# Altium schematic sheet S7_Ethernet.SchDoc
size A3; SheetNumber: 4; SheetTotal: 7
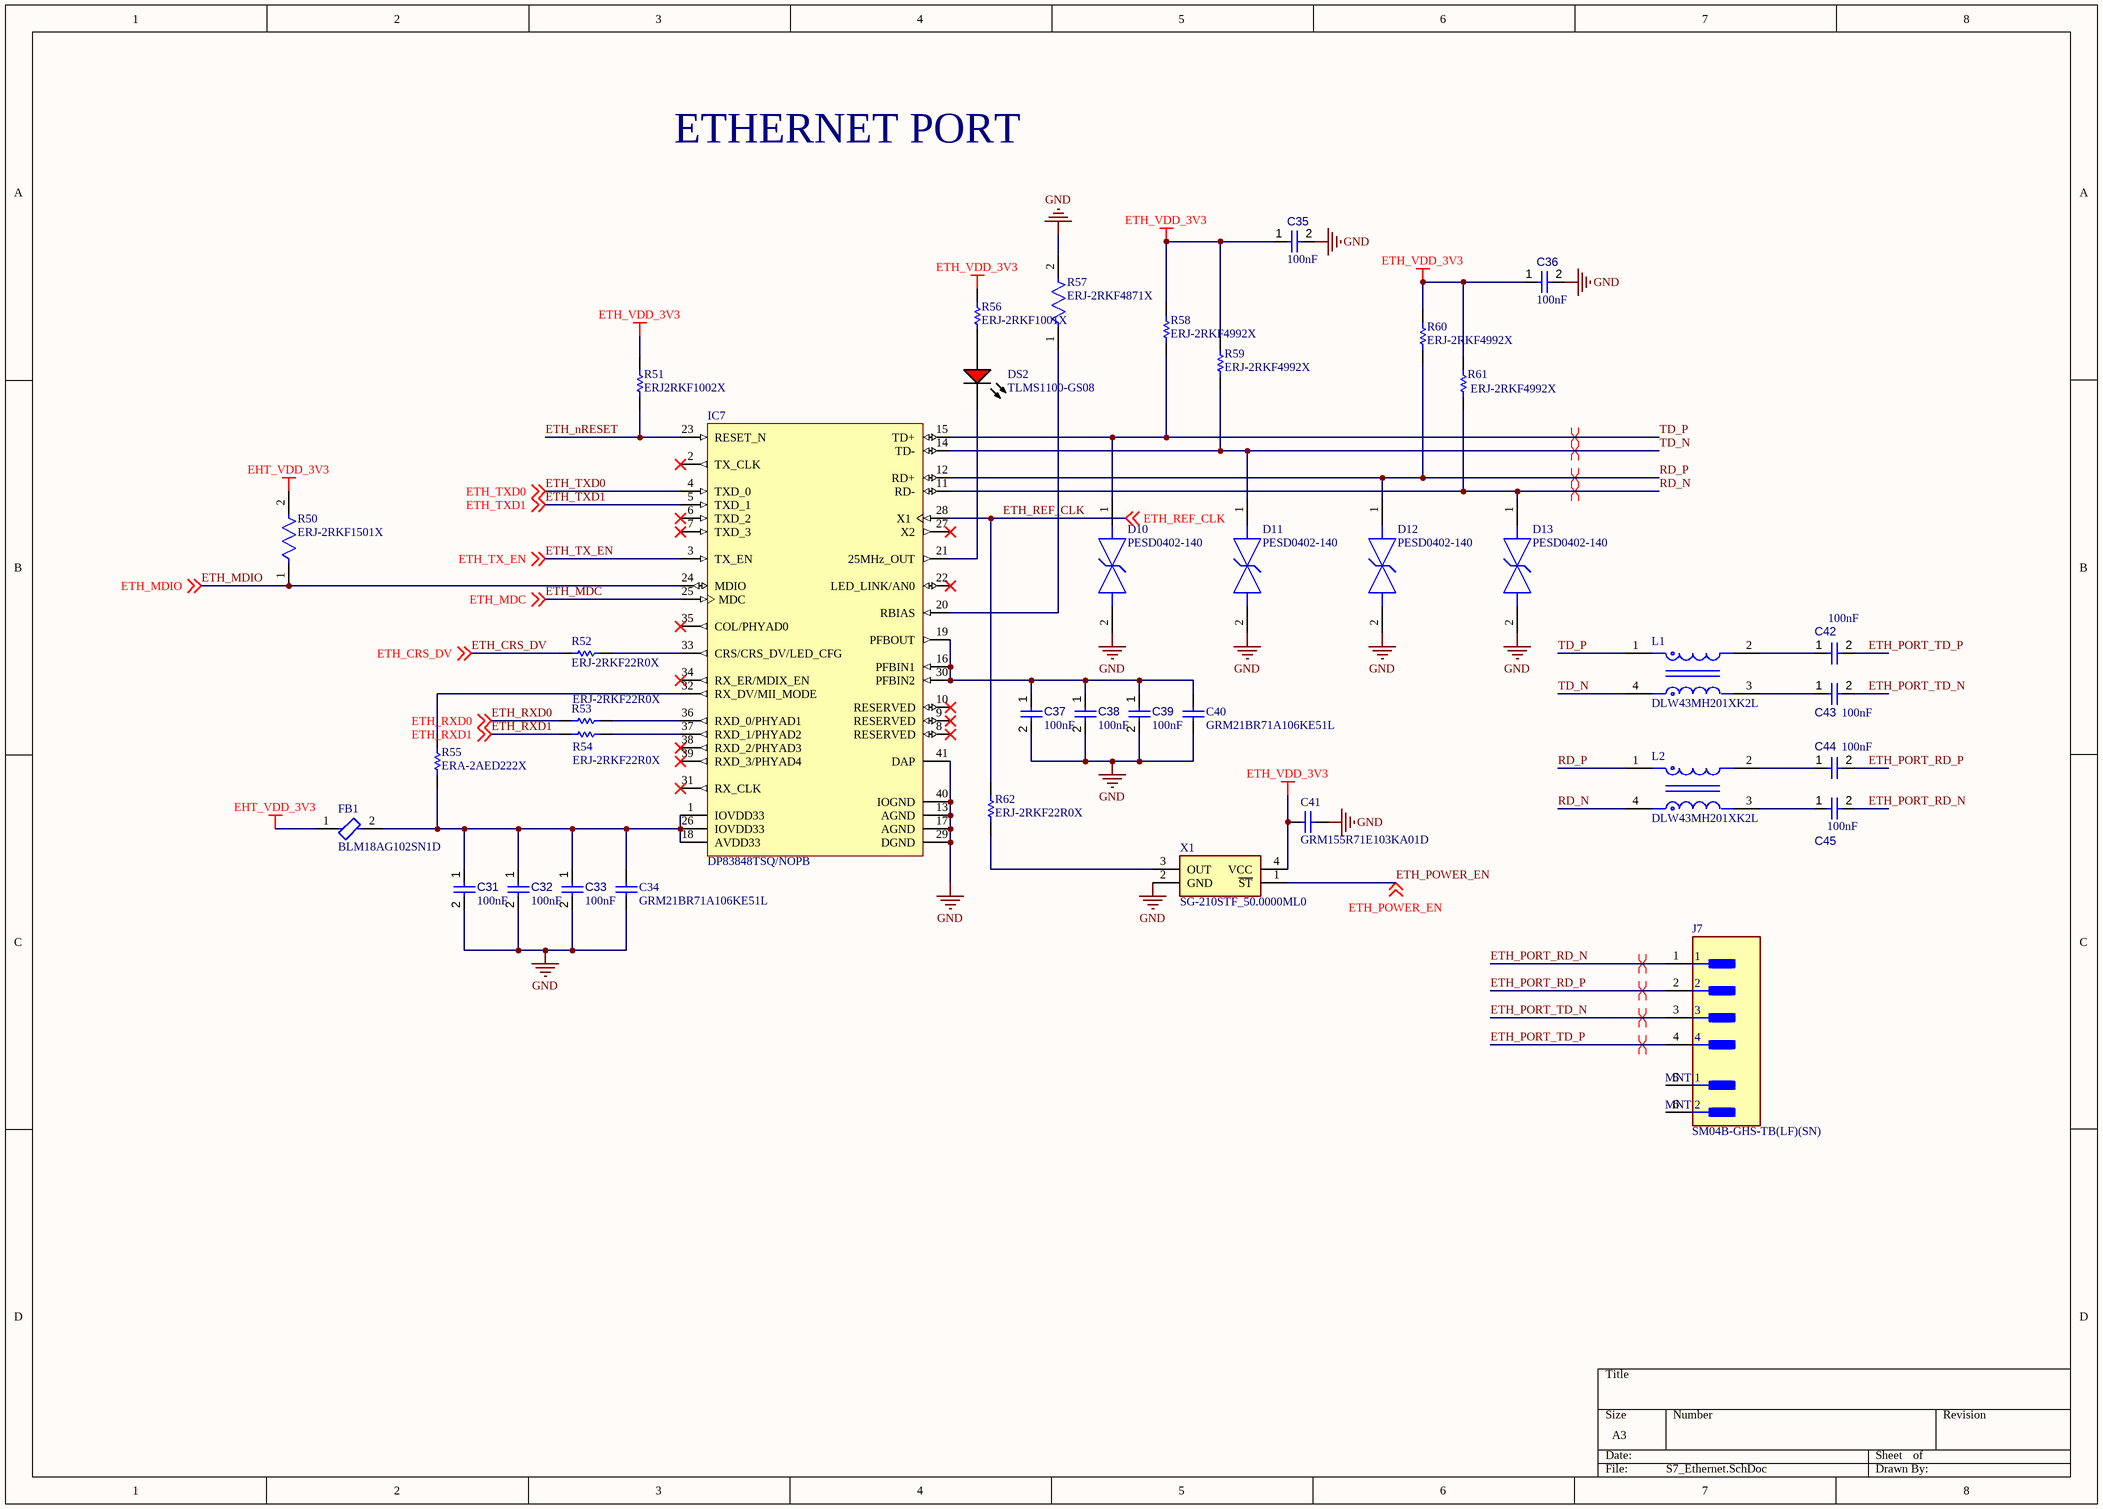
[diagram p0: S7_Ethernet.SchDoc]

## Parts
C31  value 100nF  [CAPC0402(1005)60_L]  (hidden comment: Capacitor 100nF +/-20% 25V 0402)
C32  value 100nF  [CAPC0402(1005)60_L]  (hidden comment: Capacitor 100nF +/-20% 25V 0402)
C33  value 100nF  [CAPC0402(1005)60_L]  (hidden comment: Capacitor 100nF +/-20% 25V 0402)
C34  GRM21BR71A106KE51L  [CAPC2013X140X45NL15T25]
C35  value 100nF  [CAPC0402(1005)60_L]  (hidden comment: Capacitor 100nF +/-20% 25V 0402)
C36  value 100nF  [CAPC0402(1005)60_L]  (hidden comment: Capacitor 100nF +/-20% 25V 0402)
C37  value 100nF  [CAPC0402(1005)60_L]  (hidden comment: Capacitor 100nF +/-20% 25V 0402)
C38  value 100nF  [CAPC0402(1005)60_L]  (hidden comment: Capacitor 100nF +/-20% 25V 0402)
C39  value 100nF  [CAPC0402(1005)60_L]  (hidden comment: Capacitor 100nF +/-20% 25V 0402)
C40  GRM21BR71A106KE51L  [CAPC2013X140X45NL15T25]
C41  GRM155R71E103KA01D  [CAPC1005X55X25LL05T10]
C42  value 100nF  [CAPC0402(1005)60_L]  (hidden comment: Capacitor 100nF +/-20% 25V 0402)
C43  value 100nF  [CAPC0402(1005)60_L]  (hidden comment: Capacitor 100nF +/-20% 25V 0402)
C44  value 100nF  [CAPC0402(1005)60_L]  (hidden comment: Capacitor 100nF +/-20% 25V 0402)
C45  value 100nF  [CAPC0402(1005)60_L]  (hidden comment: Capacitor 100nF +/-20% 25V 0402)
D10  PESD0402-140  [FP-PESD0402-MFG]
D11  PESD0402-140  [FP-PESD0402-MFG]
D12  PESD0402-140  [FP-PESD0402-MFG]
D13  PESD0402-140  [FP-PESD0402-MFG]
DS2  TLMS1100-GS08  [VISH-TLMX1100_V]
FB1  BLM18AG102SN1D  [FP-BLM18-0_15-t0_8-MFG]
IC7  DP83848TSQ/NOPB  [RTA0040A_V]
J7  SM04B-GHS-TB(LF)(SN)  [FP-SM04B-GHS-TB_LF_SN-MFG]
L1  DLW43MH201XK2L  [FP-DLW43-0_2-t2_7-MFG]
L2  DLW43MH201XK2L  [FP-DLW43-0_2-t2_7-MFG]
R50  ERJ-2RKF1501X  [FP-ERJ2RK-IPC_A]
R51  ERJ2RKF1002X  [RESC1005X40X25LL05T05]
R52  ERJ-2RKF22R0X  [RESC1005X40X25ML05T05]
R53  ERJ-2RKF22R0X  [RESC1005X40X25ML05T05]
R54  ERJ-2RKF22R0X  [RESC1005X40X25ML05T05]
R55  ERA-2AED222X  [RESC1005X40X25ML10T10]
R56  ERJ-2RKF1001X  [RESC1005X40X25NL05T05]
R57  ERJ-2RKF4871X  [FP-ERJ2RK-MFG]
R58  ERJ-2RKF4992X  [RESC1005X40X25LL05T05]
R59  ERJ-2RKF4992X  [RESC1005X40X25LL05T05]
R60  ERJ-2RKF4992X  [RESC1005X40X25LL05T05]
R61  ERJ-2RKF4992X  [RESC1005X40X25LL05T05]
R62  ERJ-2RKF22R0X  [RESC1005X40X25ML05T05]
X1  SG-210STF_50.0000ML0  [SG210STF500000ML0]

## Nets
EHT_VDD_3V3: FB1.1 R50.2
ETH_VDD_3V3: C35.1 C36.1 C41.1 R51.2 R56.2 R58.2 R59.2 R60.2 R61.2 X1.4(VCC)
GND: C31.2 C32.2 C33.2 C34.1 C35.2 C36.2 C37.2 C38.2 C39.2 C40.1 C41.2 D10.2 D11.2 D12.2 D13.2 IC7.13(AGND) IC7.17(AGND) IC7.29(DGND) IC7.40(IOGND) IC7.41(DAP) R57.2 X1.2(GND)
ETH_CRS_DV: R52.1 ; off-sheet ETH_CRS_DV
ETH_MDC: IC7.25(MDC) ; off-sheet ETH_MDC
ETH_MDIO: IC7.24(MDIO) R50.1 ; off-sheet ETH_MDIO
ETH_nRESET: IC7.23(RESET_N) R51.1
ETH_PORT_RD_N: C45.2 J7.1
ETH_PORT_RD_P: C44.2 J7.2
ETH_PORT_TD_N: C43.2 J7.3
ETH_PORT_TD_P: C42.2 J7.4
ETH_POWER_EN: X1.1(~{ST}) ; off-sheet ETH_POWER_EN
ETH_REF_CLK: IC7.28(X1) R62.2 ; off-sheet ETH_REF_CLK
ETH_RXD0: R53.1 ; off-sheet ETH_RXD0
ETH_RXD1: R54.1 ; off-sheet ETH_RXD1
ETH_TX_EN: IC7.3(TX_EN) ; off-sheet ETH_TX_EN
ETH_TXD0: IC7.4(TXD_0) ; off-sheet ETH_TXD0
ETH_TXD1: IC7.5(TXD_1) ; off-sheet ETH_TXD1
RD_N: D13.1 IC7.11(RD-) L2.4 R61.1
RD_P: D12.1 IC7.12(RD+) L2.1 R60.1
TD_N: D11.1 IC7.14(TD-) L1.4 R59.1
TD_P: D10.1 IC7.15(TD+) L1.1 R58.1
NetC31_1: C31.1 C32.1 C33.1 C34.2 FB1.2 IC7.1(IOVDD33) IC7.18(AVDD33) IC7.26(IOVDD33) R55.1
NetC37_1: C37.1 C38.1 C39.1 C40.2 IC7.16(PFBIN1) IC7.19(PFBOUT) IC7.30(PFBIN2)
NetC42_1: C42.1 L1.2
NetC43_1: C43.1 L1.3
NetC44_1: C44.1 L2.2
NetC45_1: C45.1 L2.3
NetDS2_1: DS2.1(A) R56.1
NetDS2_2: DS2.2(K) IC7.21(25MHz_OUT)
NetIC7_20: IC7.20(RBIAS) R57.1
NetIC7_32: IC7.32(RX_DV/MII_MODE) R55.2
NetIC7_33: IC7.33(CRS/CRS_DV/LED_CFG) R52.2
NetIC7_36: IC7.36(RXD_0/PHYAD1) R53.2
NetIC7_37: IC7.37(RXD_1/PHYAD2) R54.2
NetR62_1: R62.1 X1.3(OUT)

Not connected (* = marked no-connect by the designer): IC7 2(TX_CLK)* 6(TXD_2)* 7(TXD_3)* 8(RESERVED)* 9(RESERVED)* 10(RESERVED)* 22(LED_LINK/AN0)* 27(X2)* 31(RX_CLK)* 34(RX_ER/MDIX_EN)* 35(COL/PHYAD0)* 38(RXD_2/PHYAD3)* 39(RXD_3/PHYAD4)*; J7 5(MNT_1) 6(MNT_2)

## Layout directives
differential pair: ETH_PORT_RD_N, ETH_PORT_RD_P, ETH_PORT_TD_N, ETH_PORT_TD_P, RD_N, RD_P, TD_N, TD_P

## Notes on the sheet
- ETHERNET PORT

## Library data of the parts
C31-C33 C35-C39 C42-C45 = CMP-001-00065-4: Chip Capacitor, 100nF +/-20%, 25V, 0402, Thickness 0.6 mm; Tolerance: 10%; Max Operating Temperature: 85°C; Min Operating Temperature: -55°C; Pins: 2; Voltage Rating: 25V; Mounting Technology: SMT; Case/Package: 0402
C34 C40 = CMP-2007-03395-1: Manufacturer: Murata; Part Number: GRM21BR71A106KE51L
C41 = CMP-1034-01880-2: Manufacturer: Murata; Part Number: GRM155R71E103KA01D
D10-D13 = CMP-08607-000011-1: TVS DIODE 14V 40V 0402; Manufacturer: Littelfuse Inc.; Automotive Grade: Grade 1; Capacitance: 0.25pF; Value: 0.25pF; Direction: Bidirectional; Number Of Channels: 1; Temperature Range Low: -55°C; Lead Free: Yes; Temperature: -55°C to +125°C; Digikey Description: TVS DIODE 14V 40V 0402; Automotive: Yes; Device Class L2: TVS Diodes; Reverse Standoff Voltage: 14V; Device Class L1: Circuit Protection; Ipc Land Pattern Name: DIOC10050X33; Manufacturer Part Number: PESD0402-140; Breakdown Voltage: 14V; Height: 0.43mm; Clamping Voltage: 40V; RoHS: TRUE; Temperature Range High: +125°C; Device Class L3: unset; Octopart: https://octopart.com/pesd0402-140-littelfuse-74215061; Package: PESD0402; ComponentLink2URL: https://www.littelfuse.com/~/media/electronics/datasheets/polymer_esd_suppressors/littelfuse_polymer_esd_suppressor_pesd_catalog_datasheet.pdf.pdf; Category: Diode; ComponentLink2Description: Datasheet
DS2 = CMP-1666-00027-1: LED, RED, 2.1 V, -40 to 100 degC, 2-Pin SMD (0603), RoHS, Tape and Reel; Type (Capacitors): C0G; Resistance: 100000000000 Ohm; Capacitance: 12 pF; Voltage Rating: 50 V; Tolerance: 5%; Min Operating Temperature: -55degC; REACH SVHC: No SVHC; ComponentLink2Description: Datasheet; ComponentLink1URL: http://www.vishay.com/; Width: 0.8 mm; Package Quantity: 4000; PackageReference: TLMX1100; ComponentLink2URL: http://www.vishay.com/docs/83173/tlmb1100.pdf; Case/Package: 0603; Case Code (Metric): 1608; Packaging: Tape and Reel; Pins: 2; ComponentLink1Description: Manufacturer URL; Max Operating Temperature: 125degC; Height: 0.8 mm; Length: 1.6 mm; Mount: Surface Mount; PackageDescription: 2-Pin Surface Mount Device, Body 1.6 x 0.8 mm; DatasheetVersion: Rev. 2.7, 03/2016; Case Code (Imperial): 0603; Voltage Rating (DC): 50 V; RoHSCompliant: True; Radiation Hardening: No
FB1 = CMP-0686-00457-3: Chip Ferrite Bead, 0603, 1000Ω @ 100MHz, 0.5Ω, 25%, 450mA; Number of Circuits: 1; Max DC Current: 400mA; Shielding: Unshielded; DC Resistance (DCR): 500mR; Material: Steel; DC Resistance-Max: 700mR; Impedance: 1kR; Case Code (Imperial): 0603; Max Current Rating: 400mA; Frequency: 100MHz; Min Operating Temperature: -55°C; Case/Package: 0603; Depth: 0.8mm; Lead Free: Lead Free; Core Material: Ferrite; Current Rating: 400mA; Resistance: 500mR; Case Code (Metric): 1608; DC Current: 400mA; Package Quantity: 1; Packaging: Tape and Reel; Width: 0.8mm; Military Standard: Not; Height: 0.8mm; Series: BLM18A; Max Operating Temperature: 125°C; Tolerance: 25%; Termination: SMD/SMT; Test Frequency: 100MHz; Number of Lines: 1; Number of Pins: 2; REACH SVHC: No SVHC; Length: 1.6mm; Radiation Hardening: No
IC7 = CMP-0058-00190-4: PHYTER® Mini - Industrial Temperature Single 10/100 Ethernet Transceiver, 40-pin LLP, Pb-Free, 250 Reel; Manufacturer: Texas Instruments; PowerWise: N; PackageTopMarking: NS*UZXYTTE#*83848TSQ; CompType: Interface IC; High-Reliability: Y; PinCount: 40; RoHS: Y; PartNumber: DP83848TSQ/NOPB; ComponentLink1URL: http://www.ti.com/general/docs/lit/getliterature.tsp?genericPartNumber=DP83848T&fileType=pdf; PackageDescription: LLP, Quad, 6 x 6 x 0.8mm, 40 Lead, Small DAP, 0.5mm Pitch, No Pullback; ComponentLink1Description: Datasheet URL; PackageReference: RTA0040A
J7 = CMP-17439-000411-1: CONN HEADER SMD R/A 4POS 1.25MM; Voltage Rating: 50V; Number of Contacts: 4; Current Rating: 1A; Termination: Solder; Mount: Surface Mount; REACH SVHC: No SVHC; Packaging: Cut Tape; Contact Material: Bronze; Series: GH; Orientation: Right Angle; Lead Free: Lead Free; Housing Material: Nylon; Contact Plating: Tin; Housing Color: Natural; Number of Rows: 1; Pitch: 1.25mm; Number of Positions: 4
L1 L2 = CMP-06045-000406-1: CMC 200UH 110MA 2LN SMD AEC-Q200; Voltage Rating (DC): 20V; Number of Lines: 2; DC Resistance (DCR): 4.5R; Max Operating Temperature: 105°C; Packaging: Cut Tape; Mount: Surface Mount; Max Current Rating: 110mA; Ratings: AEC-Q200; Min Operating Temperature: -40°C
R50 = CMP-2002-00693-2: RES SMD 1.5K OHM 1% 1/10W 0402; Voltage Rating (DC): 50V; Temperature Coefficient: 100ppm/°C; Power Rating: 100mW; Resistance: 1.5kR; Features: Automotive AEC-Q200; Termination: SMD/SMT; Size Code: 0402; Mount: Surface Mount; Min Operating Temperature: -55°C; Construction: Rectangular; Case Code (Metric): 1005; Depth: 0.5mm; Max Operating Temperature: 155°C; RoHS Compliant: Yes; Packaging: Tape and Reel; Number of Pins: 2; Military Standard: Not; Package Quantity: 1; Height: 0.35mm; Resistor Type: Thick Film; Radiation Hardening: No; Length: 1mm; Case Code (Imperial): 0402; Tolerance: 1%; Voltage Rating: 50V; Resistance Tolerance: 1%; Contact Plating: Tin; Case/Package: 0402; REACH SVHC: No SVHC; Max Power Dissipation: 100mW; Series: ERJ; Technology: THICK FILM; Number of Terminations: 2; Width: 0.02inch; Lead Free: Lead Free
R51 = CMP-2000-07588-1: Chip Resistor, 10 KOhm, +/- 1%, 0.1 W, -55 to 155 degC, 0402 (1005 Metric), RoHS, Tape and Reel; Manufacturer: Panasonic; Power Rating: 100mW; Voltage Rating: 50V; Resistance: 10KOhm; Case\/Package: 0402; Temperature Coefficient: 100ppm\/degreesC; RoHSCompliant: True; Lead Free: LeadFree; Package Quantity: 1; Contact Plating: Tin; Length: 1mm; Radiation Hardening: No; REACH SVHC: NoSVHC; Max Operating Temperature: 155degC; Depth: 0.5mm; Case Code (Imperial): 0402; Military Standard: Not; Package Description: 2-Pin Surface Mount Device, Body 1 x 0.5 mm; Termination: SMD/SMT; Case Code (Metric): 1005; Height: 0.35mm; Packaging: TapeandReel; Voltage Rating (DC): 50V; Package Reference: 402; Number of Pins: 2; Tolerance: 1%; Mounting Technology: SurfaceMount; Width: 0.02inch; Mount: SurfaceMount; Datasheet URL: https://industrial.panasonic.com/cdbs/www-data/pdf/RDA0000/AOA0000C304.pdf; Composition: ThickFilm; Datasheet Version: 02/2017; Manufacturer URL: http://www.panasonic.com/; Max Power Dissipation: 100mW; Number of Terminations: 2; Min Operating Temperature: -55degC
R52-R54 R62 = CMP-2002-01135-4: Chip Resistor, 22 Ohm, +/- 1%, 0.1 W, -55 to 155 degC, 0402 (1005 Metric), RoHS, Tape and Reel; Case\/Package: 0402; Resistance: 22 Ohm; Power Rating: 100 mW; Voltage Rating: 50 V; ComponentLink2Description: Datasheet; PartNumber: ERJ-2RKF22R0X; Packaging: Tape and Reel; Weight: 2.8E-05oz; Pins: 2; Case Code (Imperial): 0402; Width: 0.5 mm; ComponentLink2URL: http://industrial.panasonic.com/cdbs/www-data/pdf/RDA0000/AOA0000C86.pdf; Height: 0.35 mm; PackageReference: 0402; REACH SVHC: Yes; Min Operating Temperature: -55 degC; Length: 1 mm; DatasheetVersion: 04/2015; RoHSCompliant: true; Package Quantity: 10000; Case Code (Metric): 1005; PackageDescription: 2-Pin Surface Mount Device, Body 1 x 0.5 mm; ComponentLink1URL: http://www.panasonic.com/; Mount: Surface Mount; Mounting Technology: Surface Mount; Tolerance: 1%; Max Operating Temperature: 155 degC; ComponentLink1Description: Manufacturer URL
R55 = CMP-2002-05848-1: Manufacturer: Panasonic; Part Number: ERA-2AED222X
R56 = CMP-1011-00510-4: Chip Resistor, 1 KOhm, +/- 1%, 100 mW, -55 to 155 degC, 0402 (1005 Metric), RoHS, Tape and Reel; Manufacturer: Basic Passives; Voltage Rating: 50 V; Case\/Package: 0402; Resistance: 1 KOhm; Power Rating: 100 mW; PartNumber: ERJ-2RKF1001X; DatasheetVersion: 04/2015; Radiation Hardening: No; Pins: 2; Height: 0.35 mm; RoHSCompliant: true; Case Code (Imperial): 0402; ComponentLink2Description: Datasheet; ComponentLink1Description: Manufacturer URL; PackageReference: 0402; Mount: Surface Mount; Package Quantity: 10000; Tolerance: 1%; ComponentLink1URL: http://www.panasonic.com/; PackageDescription: 2-Pin Surface Mount Device, Body 1 x 0.5 mm; Mounting Technology: Surface Mount; Case Code (Metric): 1005; ComponentLink2URL: http://industrial.panasonic.com/cdbs/www-data/pdf/RDA0000/AOA0000C86.pdf; REACH SVHC: Yes; Packaging: Tape and Reel; Max Operating Temperature: 155 degC; Min Operating Temperature: -55 degC; Width: 0.5 mm; Length: 1 mm
R57 = CMP-2002-00961-2: NexarPartId: 55560255; Voltage Rating (DC): 50V; Tolerance: 1%; Temperature Coefficient: 100ppm/°C; Power Rating: 100mW; Resistance: 4.87kΩ; Lead Free: Contains Lead; REACH SVHC: Yes; Number of Terminations: 2; Voltage Rating: 50V; Case Code (Imperial): 0402; Mount: Surface Mount; Features: Automotive AEC-Q200; Schedule B: 8533210045, 8533210045; Case/Package: 0402; Max Operating Temperature: 155°C; Contact Plating: Tin; Length: 1mm; Min Operating Temperature: -55°C; Termination: SMD/SMT; Packaging: Cut Tape (CT); Military Standard: Not; Composition: Thick Film; Height: 400µm; RoHS: Compliant; Lifecycle Status: Production; Width: 500µm; Case Code (Metric): 1005; Max Power Dissipation: 100mW; Depth: 500µm
R58-R61 = CMP-2002-00967-3: Chip Resistor, 49.9 KOhm, +/- 1%, 100 mW, -55 to 155 degC, 0402 (1005 Metric), RoHS, Tape and Reel; Manufacturer: Basic Passives; Case\/Package: 0402; Power Rating: 100 mW; Voltage Rating: 50 V; Pins: 2; Case Code (Imperial): 0402; Package Quantity: 10000; REACH SVHC: No SVHC; DatasheetVersion: 04/2015; Width: 0.5 mm; PartNumber: ERJ-2RKF4992X; Height: 0.35 mm; Case Code (Metric): 1005; ComponentLink2URL: http://industrial.panasonic.com/cdbs/www-data/pdf/RDA0000/AOA0000C86.pdf; Mounting Technology: Surface Mount; ComponentLink1Description: Manufacturer URL; Resistance: 49.9 KOhm; PackageDescription: 2-Pin Surface Mount Device, Body 1 x 0.5 mm; Radiation Hardening: No; RoHSCompliant: true; PackageReference: 0402; Max Operating Temperature: 155 degC; Packaging: Tape and Reel; Mount: Surface Mount; Tolerance: 1%; Min Operating Temperature: -55 degC; ComponentLink1URL: http://www.panasonic.com/; ComponentLink2Description: Datasheet; Length: 1 mm
X1 = SG-210STF_50.0000ML0: Crystal or Oscillator; Manufacturer_Name: Epson Timing; Manufacturer_Part_Number: SG-210STF 50.0000ML0; Datasheet Link: https://support.epson.biz/td/api/doc_check.php?dl=brief_SG-210STF_en.pdf; Height: 0.9mm; Mouser Part Number: 732-SG-210STF50ML0; Mouser Price/Stock: https://www.mouser.co.uk/ProductDetail/Epson-Timing/SG-210STF-50.0000ML0?qs=f9yNj16SXrJvigE28ot2ig%3D%3D; Arrow Part Number: SG-210STF 50.0000ML0; Arrow Price/Stock: https://www.arrow.com/en/products/sg-210stf50.0000ml0/epson-electronics-america?region=nac